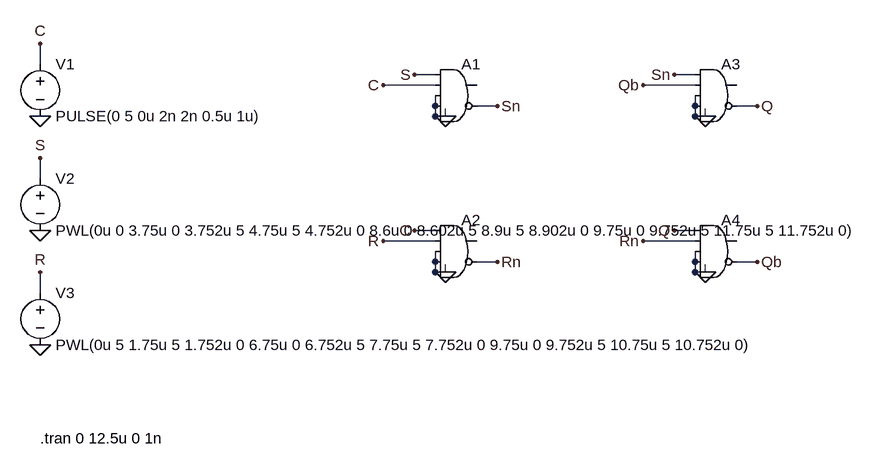
[diagram p0: schematic rs_sync_nand.asc]
rs_sync_nand.asc, the LTspice schematic file:
Version 4
SHEET 1 1504 784
WIRE -640 -16 -640 16
WIRE -640 160 -640 192
WIRE -640 336 -640 368
WIRE -64 32 -32 32
WIRE -112 48 -32 48
WIRE -32 80 -32 64
WIRE -32 96 -32 80
WIRE -16 96 -32 96
WIRE 64 80 32 80
WIRE -64 272 -32 272
WIRE -112 288 -32 288
WIRE -32 320 -32 304
WIRE -32 336 -32 320
WIRE -16 336 -32 336
WIRE 64 320 32 320
WIRE 336 32 368 32
WIRE 288 48 368 48
WIRE 368 80 368 64
WIRE 368 96 368 80
WIRE 384 96 368 96
WIRE 464 80 432 80
WIRE 336 272 368 272
WIRE 288 288 368 288
WIRE 368 320 368 304
WIRE 368 336 368 320
WIRE 384 336 368 336
WIRE 464 320 432 320
FLAG -640 -16 C
FLAG -640 96 0
FLAG -640 160 S
FLAG -640 272 0
FLAG -640 336 R
FLAG -640 448 0
FLAG -64 32 S
FLAG -112 48 C
FLAG -16 96 0
FLAG 64 80 Sn
FLAG -64 272 C
FLAG -112 288 R
FLAG -16 336 0
FLAG 64 320 Rn
FLAG 336 32 Sn
FLAG 288 48 Qb
FLAG 384 96 0
FLAG 464 80 Q
FLAG 336 272 Q
FLAG 288 288 Rn
FLAG 384 336 0
FLAG 464 320 Qb
SYMBOL voltage -640 0 R0
SYMATTR InstName V1
SYMATTR Value PULSE(0 5 0u 2n 2n 0.5u 1u)
SYMBOL voltage -640 176 R0
SYMATTR InstName V2
SYMATTR Value PWL(0u 0 3.75u 0 3.752u 5 4.75u 5 4.752u 0 8.6u 0 8.602u 5 8.9u 5 8.902u 0 9.75u 0 9.752u 5 11.75u 5 11.752u 0)
SYMBOL voltage -640 352 R0
SYMATTR InstName V3
SYMATTR Value PWL(0u 5 1.75u 5 1.752u 0 6.75u 0 6.752u 5 7.75u 5 7.752u 0 9.75u 0 9.752u 5 10.75u 5 10.752u 0)
SYMBOL Digital\\and 0 0 R0
SYMATTR InstName A1
SYMATTR SpiceLine Vhigh=5 Vlow=0 Ref=2.5 Td=10n
SYMBOL Digital\\and 0 240 R0
SYMATTR InstName A2
SYMATTR SpiceLine Vhigh=5 Vlow=0 Ref=2.5 Td=10n
SYMBOL Digital\\and 400 0 R0
SYMATTR InstName A3
SYMATTR SpiceLine Vhigh=5 Vlow=0 Ref=2.5 Td=10n
SYMBOL Digital\\and 400 240 R0
SYMATTR InstName A4
SYMATTR SpiceLine Vhigh=5 Vlow=0 Ref=2.5 Td=10n
TEXT -640 592 Left 2 !.tran 0 12.5u 0 1n

The netlist it stands for:
* rs_sync_nand.asc
V1 C 0 PULSE(0 5 0u 2n 2n 0.5u 1u)
V2 S 0 PWL(0u 0 3.75u 0 3.752u 5 4.75u 5 4.752u 0 8.6u 0 8.602u 5 8.9u 5 8.902u 0 9.75u 0 9.752u 5 11.75u 5 11.752u 0)
V3 R 0 PWL(0u 5 1.75u 5 1.752u 0 6.75u 0 6.752u 5 7.75u 5 7.752u 0 9.75u 0 9.752u 5 10.75u 5 10.752u 0)
A1 S C 0 0 0 Sn 0 0 AND Vhigh=5 Vlow=0 Ref=2.5 Td=10n
A2 C R 0 0 0 Rn 0 0 AND Vhigh=5 Vlow=0 Ref=2.5 Td=10n
A3 Sn Qb 0 0 0 Q 0 0 AND Vhigh=5 Vlow=0 Ref=2.5 Td=10n
A4 Q Rn 0 0 0 Qb 0 0 AND Vhigh=5 Vlow=0 Ref=2.5 Td=10n
.tran 0 12.5u 0 1n
.backanno
.end